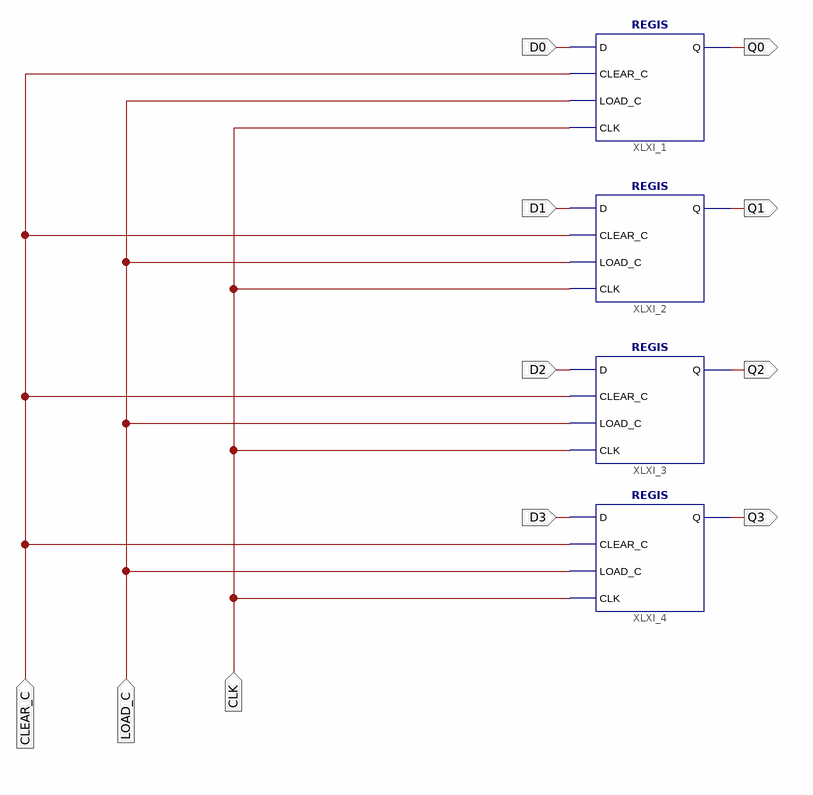
[diagram p0: schematic sheet 1]
// Xilinx ISE schematic REG_C.sch (spartan3e) as structural Verilog: 4 symbols, 11 ports
module REG_C (
  input  CLK,
  input  D0,
  input  D1,
  input  D2,
  input  D3,
  input  LOAD_C,
  input  CLEAR_C,
  output Q0,
  output Q1,
  output Q2,
  output Q3
);

  REGIS XLXI_1 (.D(D0), .CLEAR_C(CLEAR_C), .LOAD_C(LOAD_C), .CLK(CLK), .Q(Q0));
  REGIS XLXI_2 (.D(D1), .CLEAR_C(CLEAR_C), .LOAD_C(LOAD_C), .CLK(CLK), .Q(Q1));
  REGIS XLXI_3 (.D(D2), .CLEAR_C(CLEAR_C), .LOAD_C(LOAD_C), .CLK(CLK), .Q(Q2));
  REGIS XLXI_4 (.D(D3), .CLEAR_C(CLEAR_C), .LOAD_C(LOAD_C), .CLK(CLK), .Q(Q3));
endmodule
